# Altium schematic sheet Digital_output.SchDoc
size 420 x 297 mm; Разраб.: Разраб.; Пров.: Пров.; Т.контр.: Т. контр.; Н.контр.: Н. контр; Утв.: Утв.; Лист: 1; Листов: 4; Децим.  №: ХXX.XXXXX.XXX.Э3; Название: Название; Лист.: 1; Листов.: 1
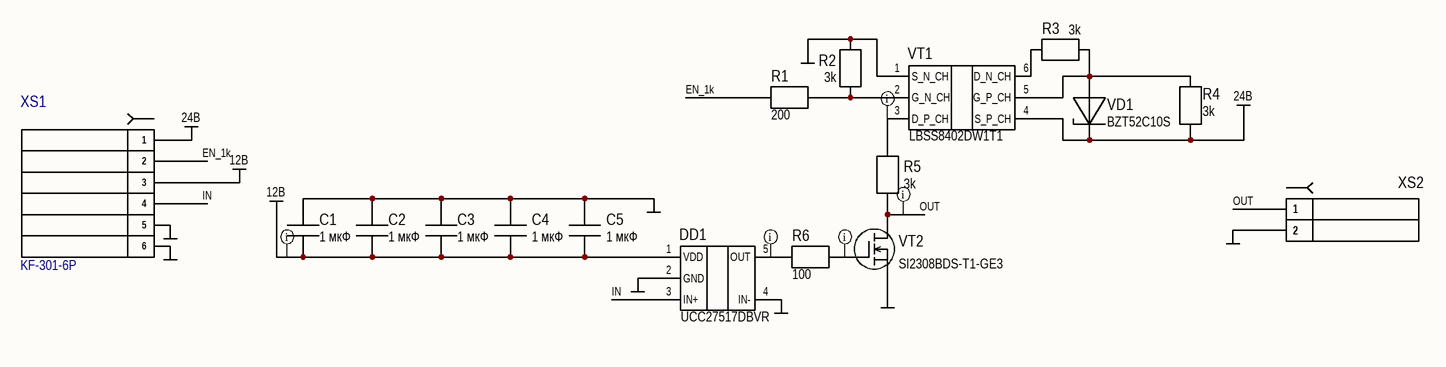
[diagram p0: Digital_output.SchDoc]

## Parts
C1  1 мкФ  [CAP 0603 3D]
C2  1 мкФ  [CAP 0603 3D]
C3  1 мкФ  [CAP 0603 3D]
C4  1 мкФ  [CAP 0603 3D]
C5  1 мкФ  [CAP 0603 3D]
DD1  UCC27517DBVR  [SOT-23-5]
R1  200  [Res_0603 3D]
R2  3k  [Res_0603 3D]
R3  3k  [Res_0603 3D]
R4  3k  [Res_0603 3D]
R5  3k  [Res_2512 3D]
R6  100  [Res_0603 3D]
VD1  BZT52C10S  [SOD-323]
VT1  LBSS8402DW1T1  [SOT-363]
VT2  SI2308BDS-T1-GE3  [SOT-23-3]
XS1  KF-301-6P  [Degson_DG301-5.0-06P-1X]
XS2  KF-301-2P  [Degson_DG301-5.0-02P-1X]  (value not drawn)

## Nets
12В: C1.2 C2.2 C3.2 C4.2 C5.2 DD1.1(VDD) XS1.3
24В: R4.1 VD1.1(K) VT1.4(S_P_CH) XS1.1
GND: C1.1 C2.1 C3.1 C4.1 C5.1 DD1.2(GND) DD1.4(IN-) R2.2 VT1.1(S_N_CH) VT2.3(S) XS1.5 XS1.6 XS2.2
EN_1k: R1.1 XS1.2
IN: DD1.3(IN+) XS1.4
OUT: R5.1 VT2.2(D) XS2.1
NetDD1_5: DD1.5(OUT) R6.1
NetR1_2: R1.2 R2.1 VT1.2(G_N_CH)
NetR3_1: R3.1 VT1.6(D_N_CH)
NetR3_2: R3.2 R4.2 VD1.2(A) VT1.5(G_P_CH)
NetR5_2: R5.2 VT1.3(D_P_CH)
NetR6_2: R6.2 VT2.1(G)

## Layout directives
net class Power: 12В, NetDD1_5, NetR5_2, NetR6_2, OUT

## Notes on the sheet
- Перв. примен.
- Справ. №
- Подп. и дата
- Инв. № дубл.
- Взам. инв. №
- Изм.
- Лист
- № докум
- Подпись
- Дата
- Лит.
- Масса
- Масштаб
- Разраб
- Пров
- Т.контр.
- Листов
- Инв.№ подл.
- Н.контр.
- Утв.

## Library data of the parts
C1-C5 = C: GCM188R71E105KA64D
DD1 = UCC27517
R1 = R: RC0603FR-07200RL
R2-R4 = R: RC0603FR-073KL
R5 = R: RC2512FR-073KL
R6 = R: RC0603FR-07100RL
VD1 = Стаб. х1 K-A
VT1 = LBSS8402DW1T1G: LBSS8402DW1T1G/BSS8402DW-7-F
VT2 = VT MOSFET-N